# Altium schematic sheet DDC.SchDoc
size A4
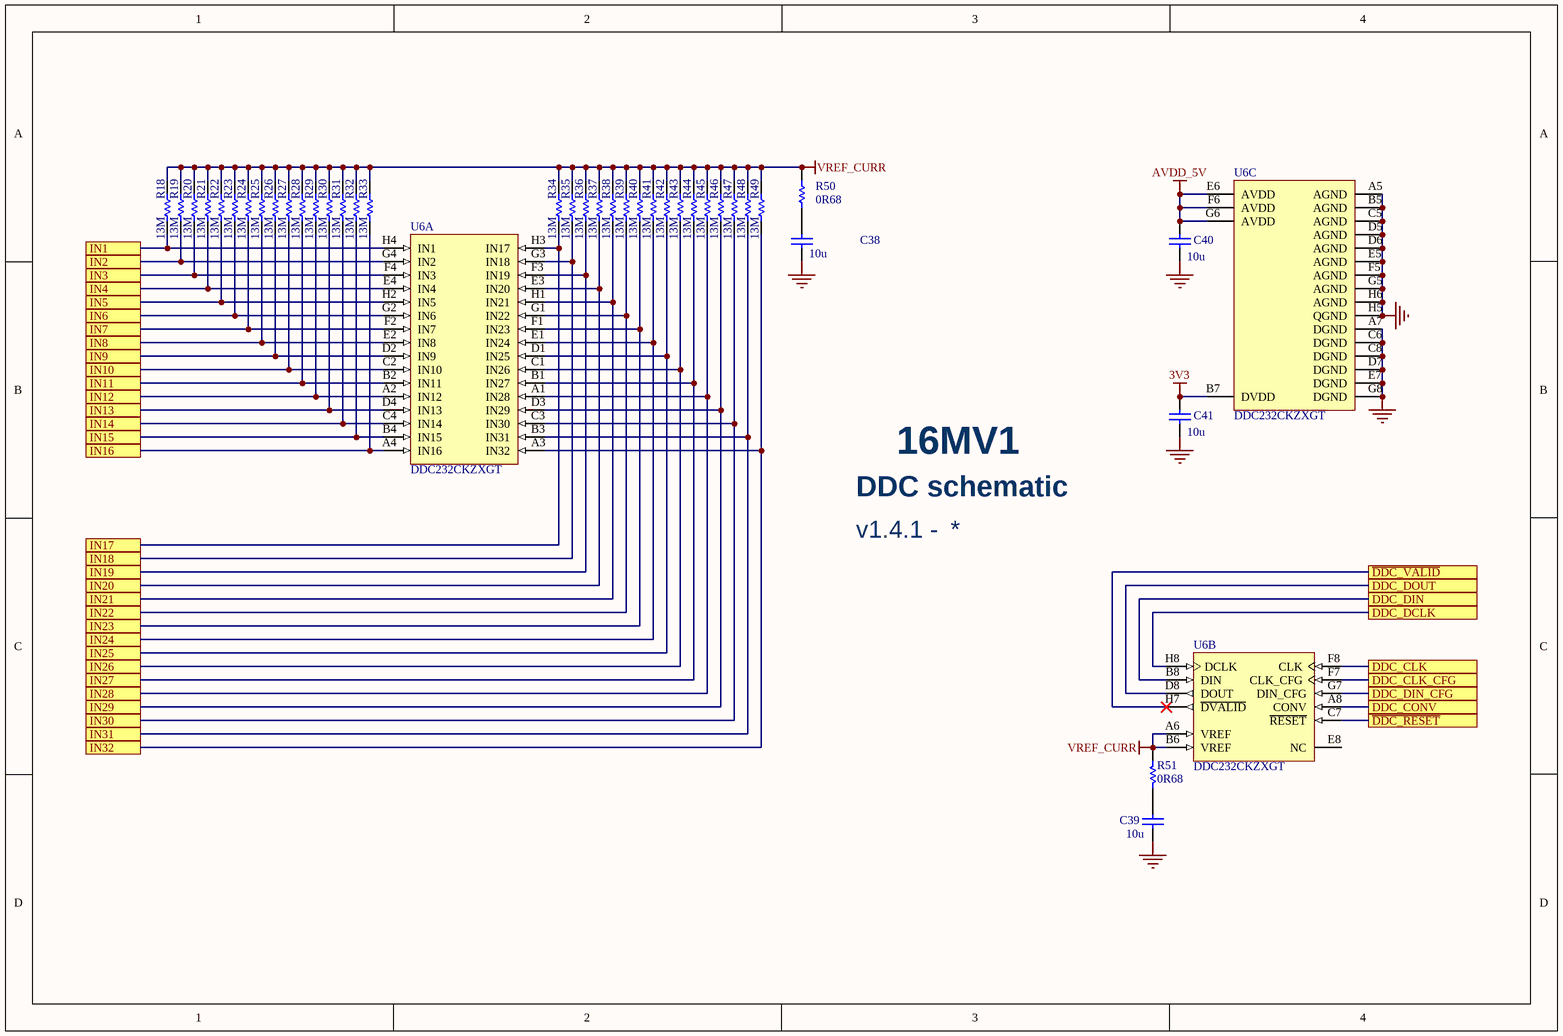
[diagram p0: DDC.SchDoc]

## Parts
C38  10u  [0603]
C39  10u  [0603]
C40  10u  [0603]
C41  10u  [0603]
R18  13M  [0402]
R19  13M  [0402]
R20  13M  [0402]
R21  13M  [0402]
R22  13M  [0402]
R23  13M  [0402]
R24  13M  [0402]
R25  13M  [0402]
R26  13M  [0402]
R27  13M  [0402]
R28  13M  [0402]
R29  13M  [0402]
R30  13M  [0402]
R31  13M  [0402]
R32  13M  [0402]
R33  13M  [0402]
R34  13M  [0402]
R35  13M  [0402]
R36  13M  [0402]
R37  13M  [0402]
R38  13M  [0402]
R39  13M  [0402]
R40  13M  [0402]
R41  13M  [0402]
R42  13M  [0402]
R43  13M  [0402]
R44  13M  [0402]
R45  13M  [0402]
R46  13M  [0402]
R47  13M  [0402]
R48  13M  [0402]
R49  13M  [0402]
R50  0R68  [0402]
R51  0R68  [0402]
U6  DDC232CKZXGT  [TI-ZXG64]  (parts A,B,C of 3)

## Ports
DDC_CLK, DDC_CLK_CFG, DDC_CONV, DDC_DCLK, DDC_DIN, DDC_DIN_CFG, DDC_DOUT, IN1, IN2, IN3, IN4, IN5, IN6, IN7, IN8, IN9, IN10, IN11, IN12, IN13, IN14, IN15, IN16, IN17, IN18, IN19, IN20, IN21, IN22, IN23, IN24, IN25, IN26, IN27, IN28, IN29, IN30, IN31, IN32, ~{DDC_RESET}, ~{DDC_VALID}

## Nets
3V3: C41.2 U6.B7(DVDD)
AVDD_5V: C40.2 U6.E6(AVDD) U6.F6(AVDD) U6.G6(AVDD)
GND: C38.2 C39.2 C40.1 C41.1 U6.A5(AGND) U6.A7(DGND) U6.B5(AGND) U6.C5(AGND) U6.C6(DGND) U6.C8(DGND) U6.D5(AGND) U6.D6(AGND) U6.D7(DGND) U6.E5(AGND) U6.E7(DGND) U6.F5(AGND) U6.G5(AGND) U6.G8(DGND) U6.H5(QGND) U6.H6(AGND)
VREF_CURR: R18.2 R19.2 R20.2 R21.2 R22.2 R23.2 R24.2 R25.2 R26.2 R27.2 R28.2 R29.2 R30.2 R31.2 R32.2 R33.2 R34.2 R35.2 R36.2 R37.2 R38.2 R39.2 R40.2 R41.2 R42.2 R43.2 R44.2 R45.2 R46.2 R47.2 R48.2 R49.2 R50.2 R51.2 U6.A6(VREF) U6.B6(VREF)
~{DDC_RESET}: U6.C7(~{RESET}) ; port ~{DDC_RESET}
~{DDC_VALID}: U6.H7(~{DVALID}) ; port ~{DDC_VALID}
DDC_CLK: U6.F8(CLK) ; port DDC_CLK
DDC_CLK_CFG: U6.F7(CLK_CFG) ; port DDC_CLK_CFG
DDC_CONV: U6.A8(CONV) ; port DDC_CONV
DDC_DCLK: U6.H8(DCLK) ; port DDC_DCLK
DDC_DIN: U6.B8(DIN) ; port DDC_DIN
DDC_DIN_CFG: U6.G7(DIN_CFG) ; port DDC_DIN_CFG
DDC_DOUT: U6.D8(DOUT) ; port DDC_DOUT
IN1: R18.1 U6.H4(IN1) ; port IN1
IN2: R19.1 U6.G4(IN2) ; port IN2
IN3: R20.1 U6.F4(IN3) ; port IN3
IN4: R21.1 U6.E4(IN4) ; port IN4
IN5: R22.1 U6.H2(IN5) ; port IN5
IN6: R23.1 U6.G2(IN6) ; port IN6
IN7: R24.1 U6.F2(IN7) ; port IN7
IN8: R25.1 U6.E2(IN8) ; port IN8
IN9: R26.1 U6.D2(IN9) ; port IN9
IN10: R27.1 U6.C2(IN10) ; port IN10
IN11: R28.1 U6.B2(IN11) ; port IN11
IN12: R29.1 U6.A2(IN12) ; port IN12
IN13: R30.1 U6.D4(IN13) ; port IN13
IN14: R31.1 U6.C4(IN14) ; port IN14
IN15: R32.1 U6.B4(IN15) ; port IN15
IN16: R33.1 U6.A4(IN16) ; port IN16
IN17: R34.1 U6.H3(IN17) ; port IN17
IN18: R35.1 U6.G3(IN18) ; port IN18
IN19: R36.1 U6.F3(IN19) ; port IN19
IN20: R37.1 U6.E3(IN20) ; port IN20
IN21: R38.1 U6.H1(IN21) ; port IN21
IN22: R39.1 U6.G1(IN22) ; port IN22
IN23: R40.1 U6.F1(IN23) ; port IN23
IN24: R41.1 U6.E1(IN24) ; port IN24
IN25: R42.1 U6.D1(IN25) ; port IN25
IN26: R43.1 U6.C1(IN26) ; port IN26
IN27: R44.1 U6.B1(IN27) ; port IN27
IN28: R45.1 U6.A1(IN28) ; port IN28
IN29: R46.1 U6.D3(IN29) ; port IN29
IN30: R47.1 U6.C3(IN30) ; port IN30
IN31: R48.1 U6.B3(IN31) ; port IN31
IN32: R49.1 U6.A3(IN32) ; port IN32
NetC38_1: C38.1 R50.1
NetC39_1: C39.1 R51.1

Not connected (* = marked no-connect by the designer): U6 E8(NC)

## Notes on the sheet
- DDC schematic
- 16MV1
- v1.4.1 -

## Library data of the parts
C38-C41 = Cap 10uF: Capacitor X5R 6.3V 10%; Published: 8-Jun-2000; LatestRevisionDate: 17-Jul-2002; LatestRevisionNote: Re-released for DXP Platform.; Publisher: Altium Limited
R18-R49 = Res 13M: Resistor 0.1W 1%; Published: 8-Jun-2000; Publisher: Altium Limited; Value: 13M; LatestRevisionDate: 17-Jul-2002; LatestRevisionNote: Re-released for DXP Platform.; PackageReference: AXIAL-0.3; PackageDescription: Axial Device, Thru-Hole; 2 Leads; 0.3 in Pin Spacing
R50 R51 = Res 0R68: Resistor 0.1W 1%; Published: 8-Jun-2000; Publisher: Altium Limited; Value: 0R68; LatestRevisionDate: 17-Jul-2002; LatestRevisionNote: Re-released for DXP Platform.; PackageReference: AXIAL-0.3; PackageDescription: Axial Device, Thru-Hole; 2 Leads; 0.3 in Pin Spacing
U6 = DDC232: 32 Channel Current-Input 20-Bit ADC, 0 to 70 degC, 64-pin BGA (ZXG64), Green (RoHS & no Sb/Br); PartNumber: DDC232CZXGR; Manufacturer: Texas Instruments; Resolution(Bits): 20; Analog Voltage AV/DD(Max)(V): 5.25; Digital Supply(Max)(V): 3.6; Architecture: Delta-Sigma; Digital Supply(Min)(V): 2.7; Sample Rate (max)(SPS): 3.125k; # Input Channels: 32; SubFamily: Low Power, 8-Bit, Dual 1.5 GSPS or Single 3.0 GSPS A/D Converter; Analog Voltage AV/DD(Min)(V): 4.75; ComponentLink3URL: http://www.ti.com/litv/pdf/mpbg581; ComponentLink1URL: http://www.ti.com/; ComponentLink2Description: Datasheet; PackageDescription: 64-Pin Plastic Ball Grid Array, Body 8 x 8 mm, Pitch 0.8 mm; ComponentLink2URL: http://www.ti.com/general/docs/lit/getliterature.tsp?genericPartNumber=DDC232&fileType=pdf; Eco-Plan: Green (RoHS & no Sb/Br); Mounting Technology: Surface Mount; PackageVersion: 4206838/A, 02/2005; PackageReference: ZXG64; ComponentLink1Description: Manufacturer URL; DatasheetVersion: SBAS331D; ComponentLink3Description: Package Specification; Manufacturer Part Number: DDC232CZXGR; Supplier 1: Digi-Key; Supplier Part Number 1: 296-27544-1-ND; Supplier 2: Mouser; Supplier Part Number 2: 595-DDC232CKZXGT